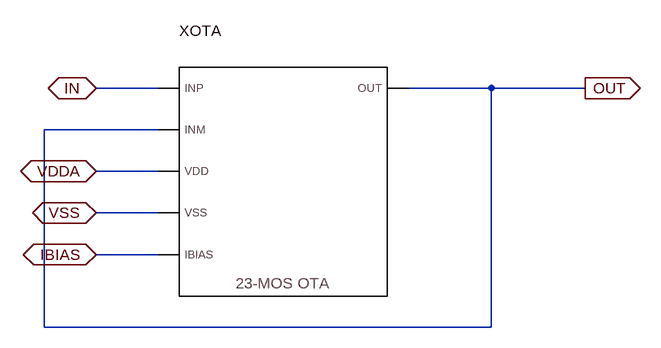
[diagram p0: schematic DAC_Buffer.asc]
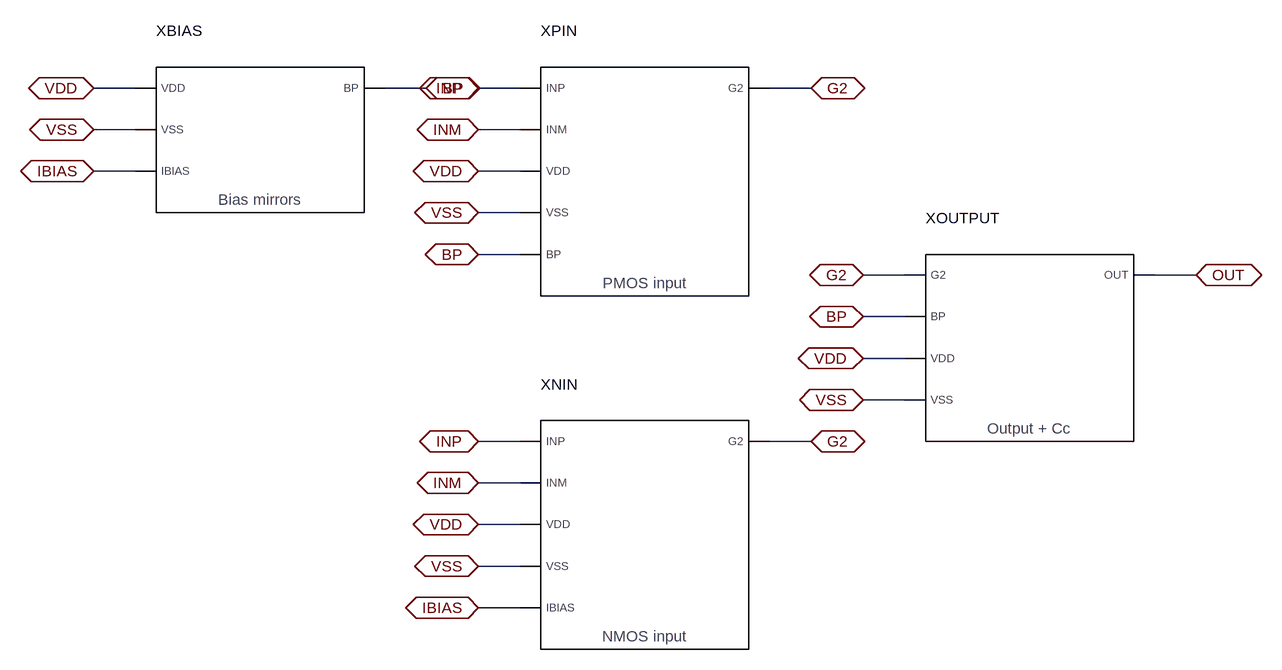
[diagram p1: sub-circuit sky_ota.asc]
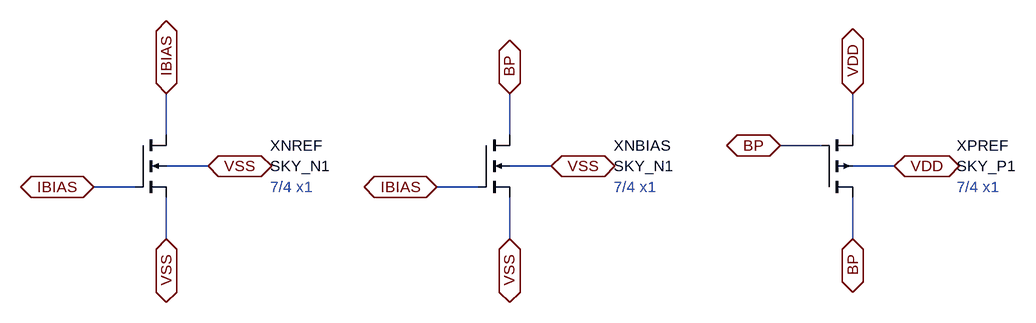
[diagram p2: sub-circuit sky_bias.asc]
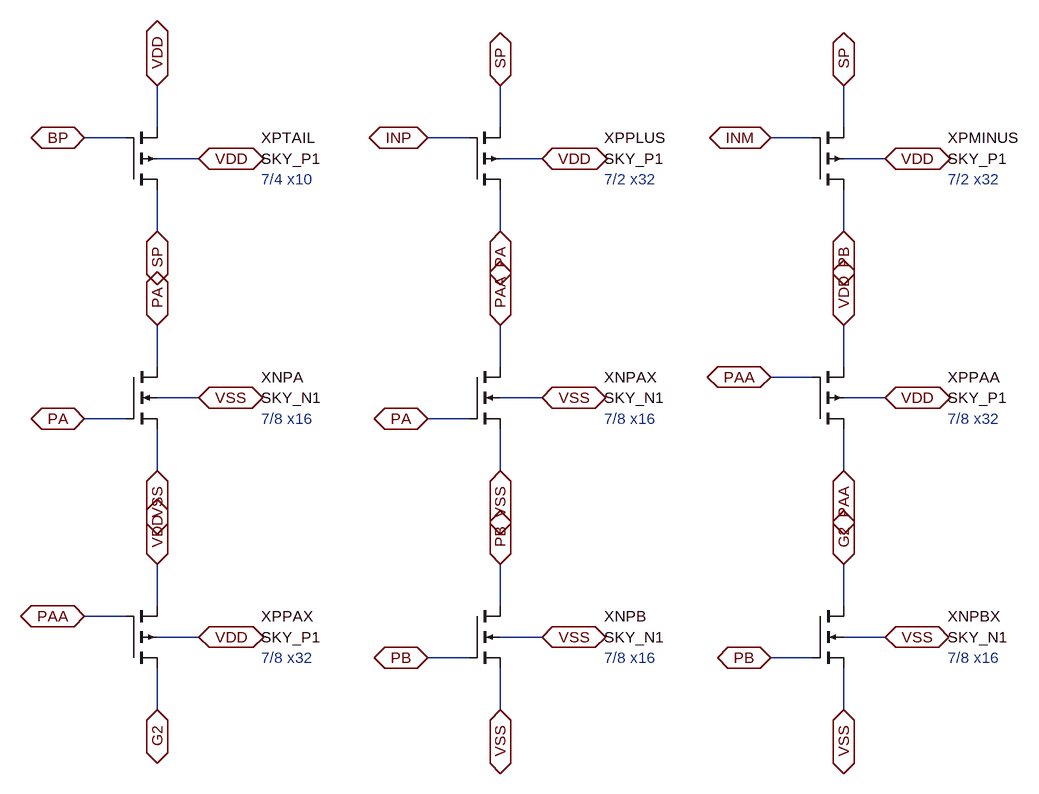
[diagram p3: sub-circuit sky_inputp.asc]
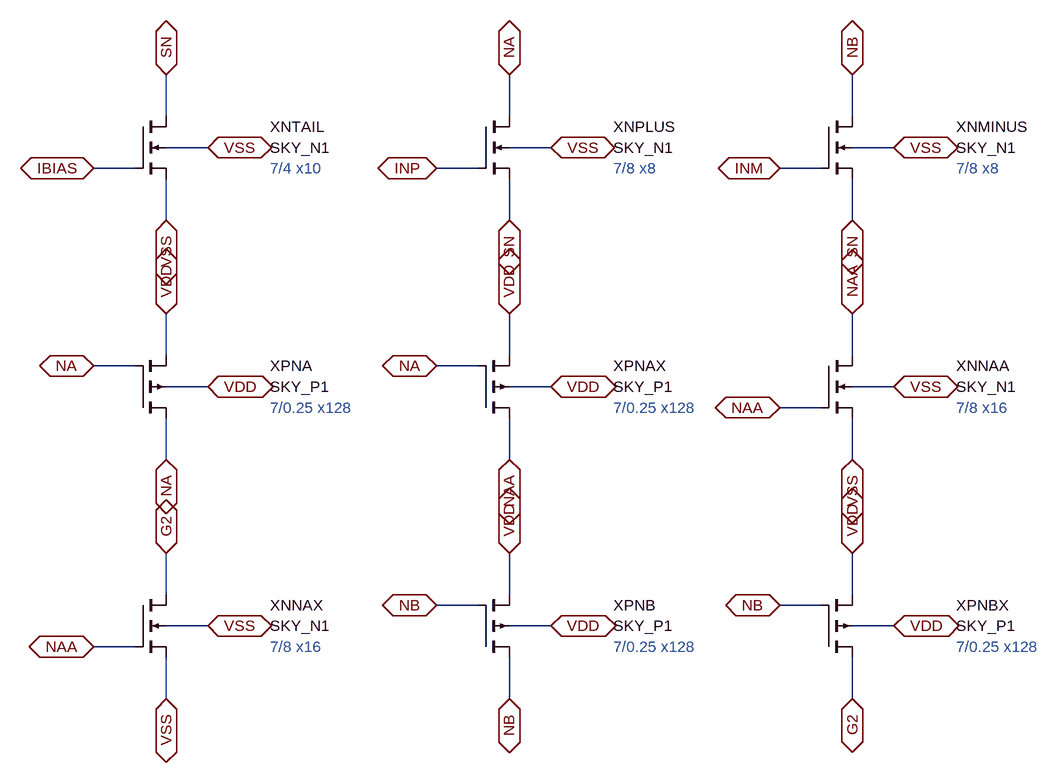
[diagram p4: sub-circuit sky_inputn.asc]
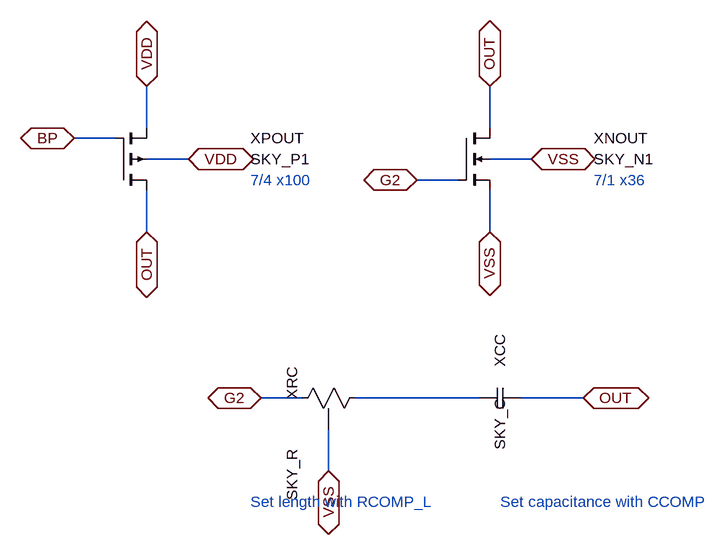
[diagram p5: sub-circuit sky_output.asc]
DAC_Buffer.asc, the LTspice schematic file:
Version 4.1
SHEET 1 1104 752
WIRE 336 240 240 240
WIRE 336 368 240 368
WIRE 336 432 240 432
WIRE 336 496 240 496
WIRE 336 304 160 304
WIRE 160 304 160 608
WIRE 160 608 848 608
WIRE 848 608 848 240
WIRE 720 240 992 240
FLAG 240 240 IN
IOPIN 240 240 BiDir
FLAG 240 368 VDDA
IOPIN 240 368 BiDir
FLAG 240 432 VSS
IOPIN 240 432 BiDir
FLAG 240 496 IBIAS
IOPIN 240 496 BiDir
FLAG 992 240 OUT
IOPIN 992 240 Out
SYMBOL Sky_OTA 336 176 R0
WINDOW 0 32 -24 Left 2
SYMATTR InstName XOTA

sky_ota.asc, the sub-circuit schematic file:
Version 4.1
SHEET 1 1904 1312
WIRE 208 192 144 192
WIRE 208 256 144 256
WIRE 208 320 144 320
WIRE 592 192 656 192
WIRE 800 192 736 192
WIRE 800 256 736 256
WIRE 800 320 736 320
WIRE 800 384 736 384
WIRE 800 448 736 448
WIRE 1184 192 1248 192
WIRE 800 736 736 736
WIRE 800 800 736 800
WIRE 800 864 736 864
WIRE 800 928 736 928
WIRE 800 992 736 992
WIRE 1184 736 1248 736
WIRE 1392 480 1328 480
WIRE 1392 544 1328 544
WIRE 1392 608 1328 608
WIRE 1392 672 1328 672
WIRE 1776 480 1840 480
FLAG 144 192 VDD
IOPIN 144 192 BiDir
FLAG 144 256 VSS
IOPIN 144 256 BiDir
FLAG 144 320 IBIAS
IOPIN 144 320 BiDir
FLAG 656 192 BP
IOPIN 656 192 BiDir
FLAG 736 192 INP
IOPIN 736 192 BiDir
FLAG 736 256 INM
IOPIN 736 256 BiDir
FLAG 736 320 VDD
IOPIN 736 320 BiDir
FLAG 736 384 VSS
IOPIN 736 384 BiDir
FLAG 736 448 BP
IOPIN 736 448 BiDir
FLAG 1248 192 G2
IOPIN 1248 192 BiDir
FLAG 736 736 INP
IOPIN 736 736 BiDir
FLAG 736 800 INM
IOPIN 736 800 BiDir
FLAG 736 864 VDD
IOPIN 736 864 BiDir
FLAG 736 928 VSS
IOPIN 736 928 BiDir
FLAG 736 992 IBIAS
IOPIN 736 992 BiDir
FLAG 1248 736 G2
IOPIN 1248 736 BiDir
FLAG 1328 480 G2
IOPIN 1328 480 BiDir
FLAG 1328 544 BP
IOPIN 1328 544 BiDir
FLAG 1328 608 VDD
IOPIN 1328 608 BiDir
FLAG 1328 672 VSS
IOPIN 1328 672 BiDir
FLAG 1840 480 OUT
IOPIN 1840 480 BiDir
SYMBOL Sky_Bias 208 128 R0
WINDOW 0 32 -24 Left 2
SYMATTR InstName XBIAS
SYMBOL Sky_InputP 800 128 R0
WINDOW 0 32 -24 Left 2
SYMATTR InstName XPIN
SYMBOL Sky_InputN 800 672 R0
WINDOW 0 32 -24 Left 2
SYMATTR InstName XNIN
SYMBOL Sky_Output 1392 416 R0
WINDOW 0 32 -24 Left 2
SYMATTR InstName XOUTPUT

sky_bias.asc, the sub-circuit schematic file:
Version 4.1
SHEET 1 1728 800
WIRE 208 160 208 96
WIRE 160 240 96 240
WIRE 208 256 208 320
WIRE 208 208 272 208
WIRE 736 160 736 96
WIRE 688 240 624 240
WIRE 736 256 736 320
WIRE 736 208 800 208
WIRE 1264 256 1264 320
WIRE 1216 176 1152 176
WIRE 1264 160 1264 96
WIRE 1264 208 1328 208
FLAG 208 96 IBIAS
IOPIN 208 96 BiDir
FLAG 96 240 IBIAS
IOPIN 96 240 BiDir
FLAG 208 320 VSS
IOPIN 208 320 BiDir
FLAG 272 208 VSS
IOPIN 272 208 BiDir
FLAG 736 96 BP
IOPIN 736 96 BiDir
FLAG 624 240 IBIAS
IOPIN 624 240 BiDir
FLAG 736 320 VSS
IOPIN 736 320 BiDir
FLAG 800 208 VSS
IOPIN 800 208 BiDir
FLAG 1264 320 BP
IOPIN 1264 320 BiDir
FLAG 1152 176 BP
IOPIN 1152 176 BiDir
FLAG 1264 96 VDD
IOPIN 1264 96 BiDir
FLAG 1328 208 VDD
IOPIN 1328 208 BiDir
SYMBOL nmos4 160 160 R0
WINDOW 0 208 16 Left 2
WINDOW 3 208 48 Left 2
SYMATTR InstName XNREF
SYMATTR Value SKY_N1
SYMATTR SpiceLine w=7 l=4 mult=1
SYMATTR Prefix X
SYMBOL nmos4 688 160 R0
WINDOW 0 208 16 Left 2
WINDOW 3 208 48 Left 2
SYMATTR InstName XNBIAS
SYMATTR Value SKY_N1
SYMATTR SpiceLine w=7 l=4 mult=1
SYMATTR Prefix X
SYMBOL pmos4 1216 256 M180
WINDOW 0 208 80 Left 2
WINDOW 3 208 48 Left 2
SYMATTR InstName XPREF
SYMATTR Value SKY_P1
SYMATTR SpiceLine w=7 l=4 mult=1
SYMATTR Prefix X
TEXT 368 240 Left 2 ;7/4 x1
TEXT 896 240 Left 2 ;7/4 x1
TEXT 1424 240 Left 2 ;7/4 x1

sky_inputp.asc, the sub-circuit schematic file:
Version 4.1
SHEET 1 1728 1408
WIRE 208 256 208 320
WIRE 160 176 96 176
WIRE 208 160 208 96
WIRE 208 208 272 208
WIRE 736 256 736 320
WIRE 688 176 624 176
WIRE 736 160 736 96
WIRE 736 208 800 208
WIRE 1264 256 1264 320
WIRE 1216 176 1152 176
WIRE 1264 160 1264 96
WIRE 1264 208 1328 208
WIRE 208 528 208 464
WIRE 160 608 96 608
WIRE 208 624 208 688
WIRE 208 576 272 576
WIRE 736 528 736 464
WIRE 688 608 624 608
WIRE 736 624 736 688
WIRE 736 576 800 576
WIRE 1264 624 1264 688
WIRE 1216 544 1152 544
WIRE 1264 528 1264 464
WIRE 1264 576 1328 576
WIRE 208 992 208 1056
WIRE 160 912 96 912
WIRE 208 896 208 832
WIRE 208 944 272 944
WIRE 736 896 736 832
WIRE 688 976 624 976
WIRE 736 992 736 1056
WIRE 736 944 800 944
WIRE 1264 896 1264 832
WIRE 1216 976 1152 976
WIRE 1264 992 1264 1056
WIRE 1264 944 1328 944
FLAG 208 320 SP
IOPIN 208 320 BiDir
FLAG 96 176 BP
IOPIN 96 176 BiDir
FLAG 208 96 VDD
IOPIN 208 96 BiDir
FLAG 272 208 VDD
IOPIN 272 208 BiDir
FLAG 736 320 PA
IOPIN 736 320 BiDir
FLAG 624 176 INP
IOPIN 624 176 BiDir
FLAG 736 96 SP
IOPIN 736 96 BiDir
FLAG 800 208 VDD
IOPIN 800 208 BiDir
FLAG 1264 320 PB
IOPIN 1264 320 BiDir
FLAG 1152 176 INM
IOPIN 1152 176 BiDir
FLAG 1264 96 SP
IOPIN 1264 96 BiDir
FLAG 1328 208 VDD
IOPIN 1328 208 BiDir
FLAG 208 464 PA
IOPIN 208 464 BiDir
FLAG 96 608 PA
IOPIN 96 608 BiDir
FLAG 208 688 VSS
IOPIN 208 688 BiDir
FLAG 272 576 VSS
IOPIN 272 576 BiDir
FLAG 736 464 PAA
IOPIN 736 464 BiDir
FLAG 624 608 PA
IOPIN 624 608 BiDir
FLAG 736 688 VSS
IOPIN 736 688 BiDir
FLAG 800 576 VSS
IOPIN 800 576 BiDir
FLAG 1264 688 PAA
IOPIN 1264 688 BiDir
FLAG 1152 544 PAA
IOPIN 1152 544 BiDir
FLAG 1264 464 VDD
IOPIN 1264 464 BiDir
FLAG 1328 576 VDD
IOPIN 1328 576 BiDir
FLAG 208 1056 G2
IOPIN 208 1056 BiDir
FLAG 96 912 PAA
IOPIN 96 912 BiDir
FLAG 208 832 VDD
IOPIN 208 832 BiDir
FLAG 272 944 VDD
IOPIN 272 944 BiDir
FLAG 736 832 PB
IOPIN 736 832 BiDir
FLAG 624 976 PB
IOPIN 624 976 BiDir
FLAG 736 1056 VSS
IOPIN 736 1056 BiDir
FLAG 800 944 VSS
IOPIN 800 944 BiDir
FLAG 1264 832 G2
IOPIN 1264 832 BiDir
FLAG 1152 976 PB
IOPIN 1152 976 BiDir
FLAG 1264 1056 VSS
IOPIN 1264 1056 BiDir
FLAG 1328 944 VSS
IOPIN 1328 944 BiDir
SYMBOL pmos4 160 256 M180
WINDOW 0 208 80 Left 2
WINDOW 3 208 48 Left 2
SYMATTR InstName XPTAIL
SYMATTR Value SKY_P1
SYMATTR SpiceLine w=7 l=4 mult=10
SYMATTR Prefix X
SYMBOL pmos4 688 256 M180
WINDOW 0 208 80 Left 2
WINDOW 3 208 48 Left 2
SYMATTR InstName XPPLUS
SYMATTR Value SKY_P1
SYMATTR SpiceLine w=7 l=2 mult=32
SYMATTR Prefix X
SYMBOL pmos4 1216 256 M180
WINDOW 0 208 80 Left 2
WINDOW 3 208 48 Left 2
SYMATTR InstName XPMINUS
SYMATTR Value SKY_P1
SYMATTR SpiceLine w=7 l=2 mult=32
SYMATTR Prefix X
SYMBOL nmos4 160 528 R0
WINDOW 0 208 16 Left 2
WINDOW 3 208 48 Left 2
SYMATTR InstName XNPA
SYMATTR Value SKY_N1
SYMATTR SpiceLine w=7 l=8 mult=16
SYMATTR Prefix X
SYMBOL nmos4 688 528 R0
WINDOW 0 208 16 Left 2
WINDOW 3 208 48 Left 2
SYMATTR InstName XNPAX
SYMATTR Value SKY_N1
SYMATTR SpiceLine w=7 l=8 mult=16
SYMATTR Prefix X
SYMBOL pmos4 1216 624 M180
WINDOW 0 208 80 Left 2
WINDOW 3 208 48 Left 2
SYMATTR InstName XPPAA
SYMATTR Value SKY_P1
SYMATTR SpiceLine w=7 l=8 mult=32
SYMATTR Prefix X
SYMBOL pmos4 160 992 M180
WINDOW 0 208 80 Left 2
WINDOW 3 208 48 Left 2
SYMATTR InstName XPPAX
SYMATTR Value SKY_P1
SYMATTR SpiceLine w=7 l=8 mult=32
SYMATTR Prefix X
SYMBOL nmos4 688 896 R0
WINDOW 0 208 16 Left 2
WINDOW 3 208 48 Left 2
SYMATTR InstName XNPB
SYMATTR Value SKY_N1
SYMATTR SpiceLine w=7 l=8 mult=16
SYMATTR Prefix X
SYMBOL nmos4 1216 896 R0
WINDOW 0 208 16 Left 2
WINDOW 3 208 48 Left 2
SYMATTR InstName XNPBX
SYMATTR Value SKY_N1
SYMATTR SpiceLine w=7 l=8 mult=16
SYMATTR Prefix X
TEXT 368 240 Left 2 ;7/4 x10
TEXT 896 240 Left 2 ;7/2 x32
TEXT 1424 240 Left 2 ;7/2 x32
TEXT 368 608 Left 2 ;7/8 x16
TEXT 896 608 Left 2 ;7/8 x16
TEXT 1424 608 Left 2 ;7/8 x32
TEXT 368 976 Left 2 ;7/8 x32
TEXT 896 976 Left 2 ;7/8 x16
TEXT 1424 976 Left 2 ;7/8 x16

sky_inputn.asc, the sub-circuit schematic file:
Version 4.1
SHEET 1 1728 1408
WIRE 208 160 208 96
WIRE 160 240 96 240
WIRE 208 256 208 320
WIRE 208 208 272 208
WIRE 736 160 736 96
WIRE 688 240 624 240
WIRE 736 256 736 320
WIRE 736 208 800 208
WIRE 1264 160 1264 96
WIRE 1216 240 1152 240
WIRE 1264 256 1264 320
WIRE 1264 208 1328 208
WIRE 208 624 208 688
WIRE 160 544 96 544
WIRE 208 528 208 464
WIRE 208 576 272 576
WIRE 736 624 736 688
WIRE 688 544 624 544
WIRE 736 528 736 464
WIRE 736 576 800 576
WIRE 1264 528 1264 464
WIRE 1216 608 1152 608
WIRE 1264 624 1264 688
WIRE 1264 576 1328 576
WIRE 208 896 208 832
WIRE 160 976 96 976
WIRE 208 992 208 1056
WIRE 208 944 272 944
WIRE 736 992 736 1056
WIRE 688 912 624 912
WIRE 736 896 736 832
WIRE 736 944 800 944
WIRE 1264 992 1264 1056
WIRE 1216 912 1152 912
WIRE 1264 896 1264 832
WIRE 1264 944 1328 944
FLAG 208 96 SN
IOPIN 208 96 BiDir
FLAG 96 240 IBIAS
IOPIN 96 240 BiDir
FLAG 208 320 VSS
IOPIN 208 320 BiDir
FLAG 272 208 VSS
IOPIN 272 208 BiDir
FLAG 736 96 NA
IOPIN 736 96 BiDir
FLAG 624 240 INP
IOPIN 624 240 BiDir
FLAG 736 320 SN
IOPIN 736 320 BiDir
FLAG 800 208 VSS
IOPIN 800 208 BiDir
FLAG 1264 96 NB
IOPIN 1264 96 BiDir
FLAG 1152 240 INM
IOPIN 1152 240 BiDir
FLAG 1264 320 SN
IOPIN 1264 320 BiDir
FLAG 1328 208 VSS
IOPIN 1328 208 BiDir
FLAG 208 688 NA
IOPIN 208 688 BiDir
FLAG 96 544 NA
IOPIN 96 544 BiDir
FLAG 208 464 VDD
IOPIN 208 464 BiDir
FLAG 272 576 VDD
IOPIN 272 576 BiDir
FLAG 736 688 NAA
IOPIN 736 688 BiDir
FLAG 624 544 NA
IOPIN 624 544 BiDir
FLAG 736 464 VDD
IOPIN 736 464 BiDir
FLAG 800 576 VDD
IOPIN 800 576 BiDir
FLAG 1264 464 NAA
IOPIN 1264 464 BiDir
FLAG 1152 608 NAA
IOPIN 1152 608 BiDir
FLAG 1264 688 VSS
IOPIN 1264 688 BiDir
FLAG 1328 576 VSS
IOPIN 1328 576 BiDir
FLAG 208 832 G2
IOPIN 208 832 BiDir
FLAG 96 976 NAA
IOPIN 96 976 BiDir
FLAG 208 1056 VSS
IOPIN 208 1056 BiDir
FLAG 272 944 VSS
IOPIN 272 944 BiDir
FLAG 736 1056 NB
IOPIN 736 1056 BiDir
FLAG 624 912 NB
IOPIN 624 912 BiDir
FLAG 736 832 VDD
IOPIN 736 832 BiDir
FLAG 800 944 VDD
IOPIN 800 944 BiDir
FLAG 1264 1056 G2
IOPIN 1264 1056 BiDir
FLAG 1152 912 NB
IOPIN 1152 912 BiDir
FLAG 1264 832 VDD
IOPIN 1264 832 BiDir
FLAG 1328 944 VDD
IOPIN 1328 944 BiDir
SYMBOL nmos4 160 160 R0
WINDOW 0 208 16 Left 2
WINDOW 3 208 48 Left 2
SYMATTR InstName XNTAIL
SYMATTR Value SKY_N1
SYMATTR SpiceLine w=7 l=4 mult=10
SYMATTR Prefix X
SYMBOL nmos4 688 160 R0
WINDOW 0 208 16 Left 2
WINDOW 3 208 48 Left 2
SYMATTR InstName XNPLUS
SYMATTR Value SKY_N1
SYMATTR SpiceLine w=7 l=8 mult=8
SYMATTR Prefix X
SYMBOL nmos4 1216 160 R0
WINDOW 0 208 16 Left 2
WINDOW 3 208 48 Left 2
SYMATTR InstName XNMINUS
SYMATTR Value SKY_N1
SYMATTR SpiceLine w=7 l=8 mult=8
SYMATTR Prefix X
SYMBOL pmos4 160 624 M180
WINDOW 0 208 80 Left 2
WINDOW 3 208 48 Left 2
SYMATTR InstName XPNA
SYMATTR Value SKY_P1
SYMATTR SpiceLine w=7 l=0.25 mult=128
SYMATTR Prefix X
SYMBOL pmos4 688 624 M180
WINDOW 0 208 80 Left 2
WINDOW 3 208 48 Left 2
SYMATTR InstName XPNAX
SYMATTR Value SKY_P1
SYMATTR SpiceLine w=7 l=0.25 mult=128
SYMATTR Prefix X
SYMBOL nmos4 1216 528 R0
WINDOW 0 208 16 Left 2
WINDOW 3 208 48 Left 2
SYMATTR InstName XNNAA
SYMATTR Value SKY_N1
SYMATTR SpiceLine w=7 l=8 mult=16
SYMATTR Prefix X
SYMBOL nmos4 160 896 R0
WINDOW 0 208 16 Left 2
WINDOW 3 208 48 Left 2
SYMATTR InstName XNNAX
SYMATTR Value SKY_N1
SYMATTR SpiceLine w=7 l=8 mult=16
SYMATTR Prefix X
SYMBOL pmos4 688 992 M180
WINDOW 0 208 80 Left 2
WINDOW 3 208 48 Left 2
SYMATTR InstName XPNB
SYMATTR Value SKY_P1
SYMATTR SpiceLine w=7 l=0.25 mult=128
SYMATTR Prefix X
SYMBOL pmos4 1216 992 M180
WINDOW 0 208 80 Left 2
WINDOW 3 208 48 Left 2
SYMATTR InstName XPNBX
SYMATTR Value SKY_P1
SYMATTR SpiceLine w=7 l=0.25 mult=128
SYMATTR Prefix X
TEXT 368 240 Left 2 ;7/4 x10
TEXT 896 240 Left 2 ;7/8 x8
TEXT 1424 240 Left 2 ;7/8 x8
TEXT 368 608 Left 2 ;7/0.25 x128
TEXT 896 608 Left 2 ;7/0.25 x128
TEXT 1424 608 Left 2 ;7/8 x16
TEXT 368 976 Left 2 ;7/8 x16
TEXT 896 976 Left 2 ;7/0.25 x128
TEXT 1424 976 Left 2 ;7/0.25 x128

sky_output.asc, the sub-circuit schematic file:
Version 4.1
SHEET 1 1728 800
WIRE 208 256 208 320
WIRE 160 176 96 176
WIRE 208 160 208 96
WIRE 208 208 272 208
WIRE 736 160 736 96
WIRE 688 240 624 240
WIRE 736 256 736 320
WIRE 736 208 800 208
WIRE 448 576 384 576
WIRE 528 576 720 576
WIRE 488 624 488 688
WIRE 784 576 880 576
FLAG 208 320 OUT
IOPIN 208 320 BiDir
FLAG 96 176 BP
IOPIN 96 176 BiDir
FLAG 208 96 VDD
IOPIN 208 96 BiDir
FLAG 272 208 VDD
IOPIN 272 208 BiDir
FLAG 736 96 OUT
IOPIN 736 96 BiDir
FLAG 624 240 G2
IOPIN 624 240 BiDir
FLAG 736 320 VSS
IOPIN 736 320 BiDir
FLAG 800 208 VSS
IOPIN 800 208 BiDir
FLAG 384 576 G2
IOPIN 384 576 BiDir
FLAG 488 688 VSS
IOPIN 488 688 BiDir
FLAG 880 576 OUT
IOPIN 880 576 BiDir
SYMBOL pmos4 160 256 M180
WINDOW 0 208 80 Left 2
WINDOW 3 208 48 Left 2
SYMATTR InstName XPOUT
SYMATTR Value SKY_P1
SYMATTR SpiceLine w=7 l=4 mult=100
SYMATTR Prefix X
SYMBOL nmos4 688 160 R0
WINDOW 0 208 16 Left 2
WINDOW 3 208 48 Left 2
SYMATTR InstName XNOUT
SYMATTR Value SKY_N1
SYMATTR SpiceLine w=7 l=1 mult=36
SYMATTR Prefix X
SYMBOL Sky_R 544 560 R90
WINDOW 0 -32 112 Left 2
WINDOW 3 96 112 Left 2
SYMATTR InstName XRC
SYMATTR Value SKY_R
SYMATTR SpiceLine l={RCOMP_L}
SYMATTR Prefix X
SYMBOL Sky_C 720 592 R270
WINDOW 0 64 32 Left 2
WINDOW 3 -64 32 Left 2
SYMATTR InstName XCC
SYMATTR Value SKY_C
SYMATTR SpiceLine w={CC_SIDE} l={CC_SIDE}
SYMATTR Prefix X
TEXT 368 240 Left 2 ;7/4 x100
TEXT 896 240 Left 2 ;7/1 x36
TEXT 368 736 Left 2 ;Set length with RCOMP_L
TEXT 752 736 Left 2 ;Set capacitance with CCOMP

The netlist it stands for:
* DAC_Buffer.asc
X§XOTA IN OUT VDDA VSS IBIAS OUT sky_ota

* block symbol definitions
.subckt sky_ota INP INM VDD VSS IBIAS OUT
X§XBIAS VDD VSS IBIAS BP sky_bias
X§XPIN INP INM VDD VSS BP G2 sky_inputp
X§XNIN INP INM VDD VSS IBIAS G2 sky_inputn
X§XOUTPUT G2 BP VDD VSS OUT sky_output
.ends sky_ota

.subckt sky_bias VDD VSS IBIAS BP
X§XNREF IBIAS IBIAS VSS VSS SKY_N1 w=7 l=4 mult=1  ; pins D G S B
X§XNBIAS BP IBIAS VSS VSS SKY_N1 w=7 l=4 mult=1  ; pins D G S B
X§XPREF BP BP VDD VDD SKY_P1 w=7 l=4 mult=1  ; pins D G S B
* 7/4 x1
* 7/4 x1
* 7/4 x1
.ends sky_bias

.subckt sky_inputp INP INM VDD VSS BP G2
X§XPTAIL SP BP VDD VDD SKY_P1 w=7 l=4 mult=10  ; pins D G S B
X§XPPLUS PA INP SP VDD SKY_P1 w=7 l=2 mult=32  ; pins D G S B
X§XPMINUS PB INM SP VDD SKY_P1 w=7 l=2 mult=32  ; pins D G S B
X§XNPA PA PA VSS VSS SKY_N1 w=7 l=8 mult=16  ; pins D G S B
X§XNPAX PAA PA VSS VSS SKY_N1 w=7 l=8 mult=16  ; pins D G S B
X§XPPAA PAA PAA VDD VDD SKY_P1 w=7 l=8 mult=32  ; pins D G S B
X§XPPAX G2 PAA VDD VDD SKY_P1 w=7 l=8 mult=32  ; pins D G S B
X§XNPB PB PB VSS VSS SKY_N1 w=7 l=8 mult=16  ; pins D G S B
X§XNPBX G2 PB VSS VSS SKY_N1 w=7 l=8 mult=16  ; pins D G S B
* 7/4 x10
* 7/2 x32
* 7/2 x32
* 7/8 x16
* 7/8 x16
* 7/8 x32
* 7/8 x32
* 7/8 x16
* 7/8 x16
.ends sky_inputp

.subckt sky_inputn INP INM VDD VSS IBIAS G2
X§XNTAIL SN IBIAS VSS VSS SKY_N1 w=7 l=4 mult=10  ; pins D G S B
X§XNPLUS NA INP SN VSS SKY_N1 w=7 l=8 mult=8  ; pins D G S B
X§XNMINUS NB INM SN VSS SKY_N1 w=7 l=8 mult=8  ; pins D G S B
X§XPNA NA NA VDD VDD SKY_P1 w=7 l=0.25 mult=128  ; pins D G S B
X§XPNAX NAA NA VDD VDD SKY_P1 w=7 l=0.25 mult=128  ; pins D G S B
X§XNNAA NAA NAA VSS VSS SKY_N1 w=7 l=8 mult=16  ; pins D G S B
X§XNNAX G2 NAA VSS VSS SKY_N1 w=7 l=8 mult=16  ; pins D G S B
X§XPNB NB NB VDD VDD SKY_P1 w=7 l=0.25 mult=128  ; pins D G S B
X§XPNBX G2 NB VDD VDD SKY_P1 w=7 l=0.25 mult=128  ; pins D G S B
* 7/4 x10
* 7/8 x8
* 7/8 x8
* 7/0.25 x128
* 7/0.25 x128
* 7/8 x16
* 7/8 x16
* 7/0.25 x128
* 7/0.25 x128
.ends sky_inputn

.subckt sky_output G2 BP VDD VSS OUT
X§XPOUT OUT BP VDD VDD SKY_P1 w=7 l=4 mult=100  ; pins D G S B
X§XNOUT OUT G2 VSS VSS SKY_N1 w=7 l=1 mult=36  ; pins D G S B
X§XRC N001 G2 VSS SKY_R l={RCOMP_L}  ; pins A B SUB
X§XCC N001 OUT SKY_C w={CC_SIDE} l={CC_SIDE}  ; pins A B
* 7/4 x100
* 7/1 x36
* Set length with RCOMP_L
* Set capacitance with CCOMP
.ends sky_output

.backanno
.end